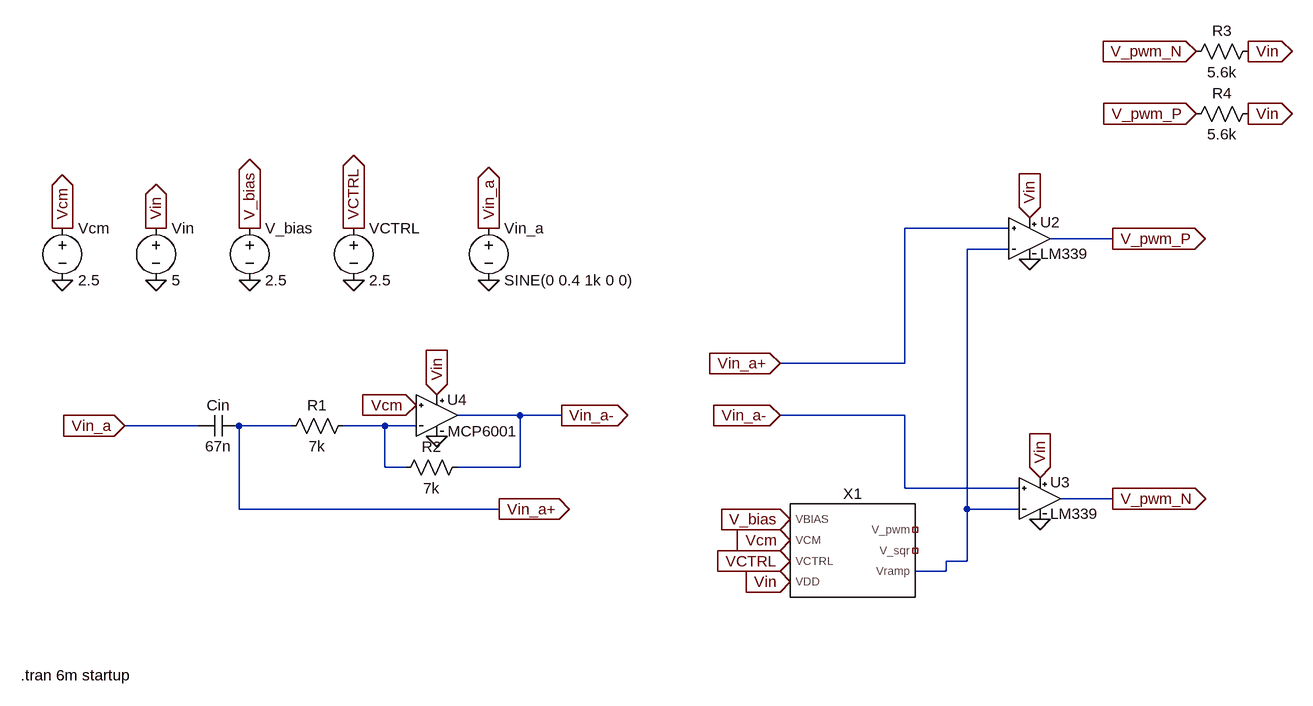
[diagram p0: schematic Exp4.asc]
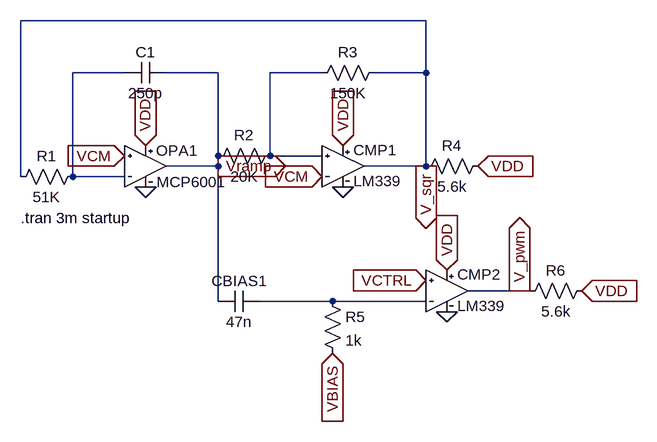
[diagram p1: sub-circuit exp1_block.asc]
Exp4.asc, the LTspice schematic file:
Version 4.1
SHEET 1 1808 680
WIRE 1344 -192 1184 -192
WIRE 1504 -176 1408 -176
WIRE 1344 -160 1280 -160
WIRE 1184 16 1184 -192
WIRE 1184 16 992 16
WIRE 592 96 496 96
WIRE 656 96 592 96
WIRE 1184 96 992 96
WIRE 96 112 -16 112
WIRE 240 112 160 112
WIRE 384 112 320 112
WIRE 432 112 384 112
WIRE 384 176 384 112
WIRE 416 176 384 176
WIRE 592 176 592 96
WIRE 592 176 496 176
WIRE 1184 208 1184 96
WIRE 1360 208 1184 208
WIRE 1504 224 1424 224
WIRE 160 240 160 112
WIRE 560 240 160 240
WIRE 1280 240 1280 -160
WIRE 1360 240 1280 240
WIRE 1280 320 1280 240
WIRE 1280 320 1248 320
WIRE 1248 336 1248 320
WIRE 1248 336 1200 336
FLAG -16 112 Vin_a
IOPIN -16 112 In
FLAG 560 240 Vin_a+
IOPIN 560 240 Out
FLAG 656 96 Vin_a-
IOPIN 656 96 Out
FLAG 992 16 Vin_a+
IOPIN 992 16 In
FLAG 992 96 Vin_a-
IOPIN 992 96 In
FLAG 1504 -176 V_pwm_P
IOPIN 1504 -176 Out
FLAG 1504 224 V_pwm_N
IOPIN 1504 224 Out
FLAG 464 128 0
FLAG 1392 256 0
FLAG 1376 -144 0
FLAG 432 80 Vcm
IOPIN 432 80 In
FLAG -112 -192 Vcm
IOPIN -112 -192 Out
FLAG -112 -112 0
FLAG 32 -192 Vin
IOPIN 32 -192 Out
FLAG 32 -112 0
FLAG 1376 -208 Vin
IOPIN 1376 -208 In
FLAG 1392 192 Vin
IOPIN 1392 192 In
FLAG 176 -192 V_bias
IOPIN 176 -192 Out
FLAG 176 -112 0
FLAG 336 -112 0
FLAG 336 -192 VCTRL
IOPIN 336 -192 Out
FLAG 464 64 Vin
IOPIN 464 64 In
FLAG 544 -112 0
FLAG 544 -192 Vin_a
IOPIN 544 -192 Out
FLAG 1632 -368 V_pwm_P
IOPIN 1632 -368 In
FLAG 1632 -464 V_pwm_N
IOPIN 1632 -464 In
FLAG 1712 -464 Vin
IOPIN 1712 -464 Out
FLAG 1712 -368 Vin
IOPIN 1712 -368 Out
FLAG 1008 256 V_bias
IOPIN 1008 256 In
FLAG 1008 288 Vcm
IOPIN 1008 288 In
FLAG 1008 320 VCTRL
IOPIN 1008 320 In
FLAG 1008 352 Vin
IOPIN 1008 352 In
SYMBOL cap 160 96 R90
WINDOW 0 0 32 VBottom 2
WINDOW 3 32 32 VTop 2
SYMATTR InstName Cin
SYMATTR Value 67n
SYMBOL res 336 96 R90
WINDOW 0 0 56 VBottom 2
WINDOW 3 32 56 VTop 2
SYMATTR InstName R1
SYMATTR Value 7k
SYMBOL res 512 160 R90
WINDOW 0 0 56 VBottom 2
WINDOW 3 32 56 VTop 2
SYMATTR InstName R2
SYMATTR Value 7k
SYMBOL LM339 1408 -176 R0
SYMATTR InstName U2
SYMBOL LM339 1424 224 R0
SYMATTR InstName U3
SYMBOL MCP6001 464 96 R0
SYMATTR InstName U4
SYMBOL voltage -112 -208 R0
SYMATTR InstName Vcm
SYMATTR Value 2.5
SYMBOL voltage 32 -208 R0
SYMATTR InstName Vin
SYMATTR Value 5
SYMBOL voltage 176 -208 R0
SYMATTR InstName V_bias
SYMATTR Value 2.5
SYMBOL voltage 336 -208 R0
SYMATTR InstName VCTRL
SYMATTR Value 2.5
SYMBOL voltage 544 -208 R0
WINDOW 123 0 0 Left 0
WINDOW 39 0 0 Left 0
SYMATTR InstName Vin_a
SYMATTR Value SINE(0 0.4 1k 0 0)
SYMBOL res 1728 -480 R90
WINDOW 0 0 56 VBottom 2
WINDOW 3 32 56 VTop 2
SYMATTR InstName R3
SYMATTR Value 5.6k
SYMBOL res 1728 -384 R90
WINDOW 0 0 56 VBottom 2
WINDOW 3 32 56 VTop 2
SYMATTR InstName R4
SYMATTR Value 5.6k
SYMBOL Exp1_block 1104 304 R0
SYMATTR InstName X1
TEXT -176 496 Left 2 !.tran 6m startup

exp1_block.asc, the sub-circuit schematic file:
Version 4.1
SHEET 1 880 680
WIRE 288 -160 -336 -160
WIRE -176 -80 -256 -80
WIRE -32 -80 -112 -80
WIRE 128 -80 48 -80
WIRE 288 -80 288 -160
WIRE 288 -80 208 -80
WIRE -32 48 -32 -80
WIRE 48 48 48 -80
WIRE 128 48 48 48
WIRE -32 64 -32 48
WIRE -32 64 -112 64
WIRE 288 64 288 -80
WIRE 288 64 192 64
WIRE -336 80 -336 -160
WIRE -256 80 -256 -80
WIRE -176 80 -256 80
WIRE 432 256 352 256
WIRE 448 256 432 256
WIRE -32 272 -32 64
WIRE 144 272 32 272
WIRE 288 272 144 272
FLAG -176 48 VCM
IOPIN -176 48 In
FLAG -144 32 VDD
IOPIN -144 32 In
FLAG -144 96 0
FLAG 160 96 0
FLAG 160 32 VDD
IOPIN 160 32 In
FLAG 128 80 VCM
IOPIN 128 80 In
FLAG 320 224 VDD
IOPIN 320 224 In
FLAG 320 288 0
FLAG 288 240 VCTRL
IOPIN 288 240 In
FLAG 144 352 VBIAS
IOPIN 144 352 In
FLAG 368 64 VDD
IOPIN 368 64 In
FLAG 528 256 VDD
IOPIN 528 256 In
FLAG -32 64 Vramp
IOPIN -32 64 Out
FLAG 288 64 V_sqr
IOPIN 288 64 Out
FLAG 432 256 V_pwm
IOPIN 432 256 Out
SYMBOL MCP6001 -144 64 R0
SYMATTR InstName OPA1
SYMBOL cap -112 -96 R90
WINDOW 0 0 32 VBottom 2
WINDOW 3 32 32 VTop 2
SYMATTR InstName C1
SYMATTR Value 250p
SYMBOL res -240 64 R90
WINDOW 0 0 56 VBottom 2
WINDOW 3 32 56 VTop 2
SYMATTR InstName R1
SYMATTR Value 51K
SYMBOL res 64 32 R90
WINDOW 0 0 56 VBottom 2
WINDOW 3 32 56 VTop 2
SYMATTR InstName R2
SYMATTR Value 20K
SYMBOL LM339 192 64 R0
SYMATTR InstName CMP1
SYMBOL res 224 -96 R90
WINDOW 0 0 56 VBottom 2
WINDOW 3 32 56 VTop 2
SYMATTR InstName R3
SYMATTR Value 150K
SYMBOL res 384 48 R90
WINDOW 0 0 56 VBottom 2
WINDOW 3 32 56 VTop 2
SYMATTR InstName R4
SYMATTR Value 5.6k
SYMBOL LM339 352 256 R0
SYMATTR InstName CMP2
SYMBOL cap 32 256 R90
WINDOW 0 0 32 VBottom 2
WINDOW 3 32 32 VTop 2
SYMATTR InstName CBIAS1
SYMATTR Value 47n
SYMBOL res 128 256 R0
SYMATTR InstName R5
SYMATTR Value 1k
SYMBOL res 544 240 R90
WINDOW 0 0 56 VBottom 2
WINDOW 3 32 56 VTop 2
SYMATTR InstName R6
SYMATTR Value 5.6k
TEXT -336 144 Left 2 !.tran 3m startup

The netlist it stands for:
* Exp4.asc
Cin Vin_a+ Vin_a 67n
R1 N002 Vin_a+ 7k
R2 Vin_a- N002 7k
X§U2 Vin_a+ N001 Vin 0 V_pwm_P LM339
X§U3 Vin_a- N001 Vin 0 V_pwm_N LM339
X§U4 Vcm N002 Vin 0 Vin_a- MCP6001
Vcm Vcm 0 2.5
Vin Vin 0 5
V_bias V_bias 0 2.5
VCTRL VCTRL 0 2.5
Vin_a Vin_a 0 SINE(0 0.4 1k 0 0)
R3 Vin V_pwm_N 5.6k
R4 Vin V_pwm_P 5.6k
X§X1 V_bias Vcm VCTRL Vin NC_01 NC_02 N001 exp1_block

* block symbol definitions
.subckt exp1_block VBIAS VCM VCTRL VDD V_pwm V_sqr Vramp
X§OPA1 VCM N001 VDD 0 Vramp MCP6001
C1 Vramp N001 250p
R1 N001 V_sqr 51K
R2 N002 Vramp 20K
X§CMP1 N002 VCM VDD 0 V_sqr LM339
R3 V_sqr N002 150K
R4 VDD V_sqr 5.6k
X§CMP2 VCTRL N003 VDD 0 V_pwm LM339
CBIAS1 N003 Vramp 47n
R5 N003 VBIAS 1k
R6 VDD V_pwm 5.6k
.tran 3m startup
.ends exp1_block

.tran 6m startup
.lib ./LM339.lib
.lib ./MCP6001.lib
.backanno
.end